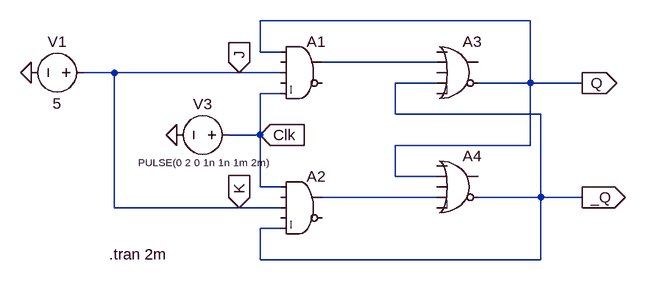
[diagram p0: schematic tff.asc]
tff.asc, the LTspice schematic file:
Version 4.1
SHEET 1 880 680
WIRE 480 16 64 16
WIRE 64 64 64 16
WIRE 96 64 64 64
WIRE 336 80 160 80
WIRE -160 96 -208 96
WIRE 32 96 -160 96
WIRE 96 96 32 96
WIRE 336 112 272 112
WIRE 480 112 480 16
WIRE 480 112 400 112
WIRE 560 112 480 112
WIRE 96 128 64 128
WIRE 272 160 272 112
WIRE 496 160 272 160
WIRE 64 192 64 128
WIRE 64 192 16 192
WIRE 480 208 480 112
WIRE 480 208 272 208
WIRE 272 256 272 208
WIRE 336 256 272 256
WIRE 64 272 64 192
WIRE 96 272 64 272
WIRE 336 288 160 288
WIRE 496 288 496 160
WIRE 496 288 400 288
WIRE 560 288 496 288
WIRE -160 304 -160 96
WIRE 32 304 -160 304
WIRE 96 304 32 304
WIRE 96 336 64 336
WIRE 64 384 64 336
WIRE 496 384 496 288
WIRE 496 384 64 384
FLAG -288 96 0
FLAG -64 192 0
FLAG 32 96 J
IOPIN 32 96 In
FLAG 32 304 K
IOPIN 32 304 In
FLAG 64 192 Clk
IOPIN 64 192 In
FLAG 560 112 Q
IOPIN 560 112 Out
FLAG 560 288 _Q
IOPIN 560 288 Out
SYMBOL Digital\\and 128 32 R0
SYMATTR InstName A1
SYMBOL Digital\\and 128 240 R0
SYMATTR InstName A2
SYMBOL voltage -192 96 R90
WINDOW 0 -32 56 VBottom 2
WINDOW 3 32 56 VTop 2
WINDOW 123 0 0 Left 0
WINDOW 39 0 0 Left 0
SYMATTR InstName V1
SYMATTR Value 5
SYMBOL voltage 32 192 R90
WINDOW 0 -32 56 VBottom 2
WINDOW 3 32 56 VTop 1
WINDOW 123 0 0 Left 0
WINDOW 39 0 0 Left 0
SYMATTR InstName V3
SYMATTR Value PULSE(0 2 0 1n 1n 1m 2m)
SYMBOL Digital\\or 368 32 R0
SYMATTR InstName A3
SYMBOL Digital\\or 368 208 R0
SYMATTR InstName A4
TEXT -168 376 Left 2 !.tran 2m

The netlist it stands for:
* tff.asc
A1 Q 0 K 0 Clk 0 N001 0 AND
A2 Clk 0 K 0 _Q 0 N002 0 AND
V1 K 0 5
V3 Clk 0 PULSE(0 2 0 1n 1n 1m 2m)
A3 0 N001 0 _Q 0 Q 0 0 OR
A4 0 Q 0 N002 0 _Q 0 0 OR
.tran 2m
.backanno
.end